# Altium project EVLSERVO1_control_v2.PrjPcb (part 9 of 9)
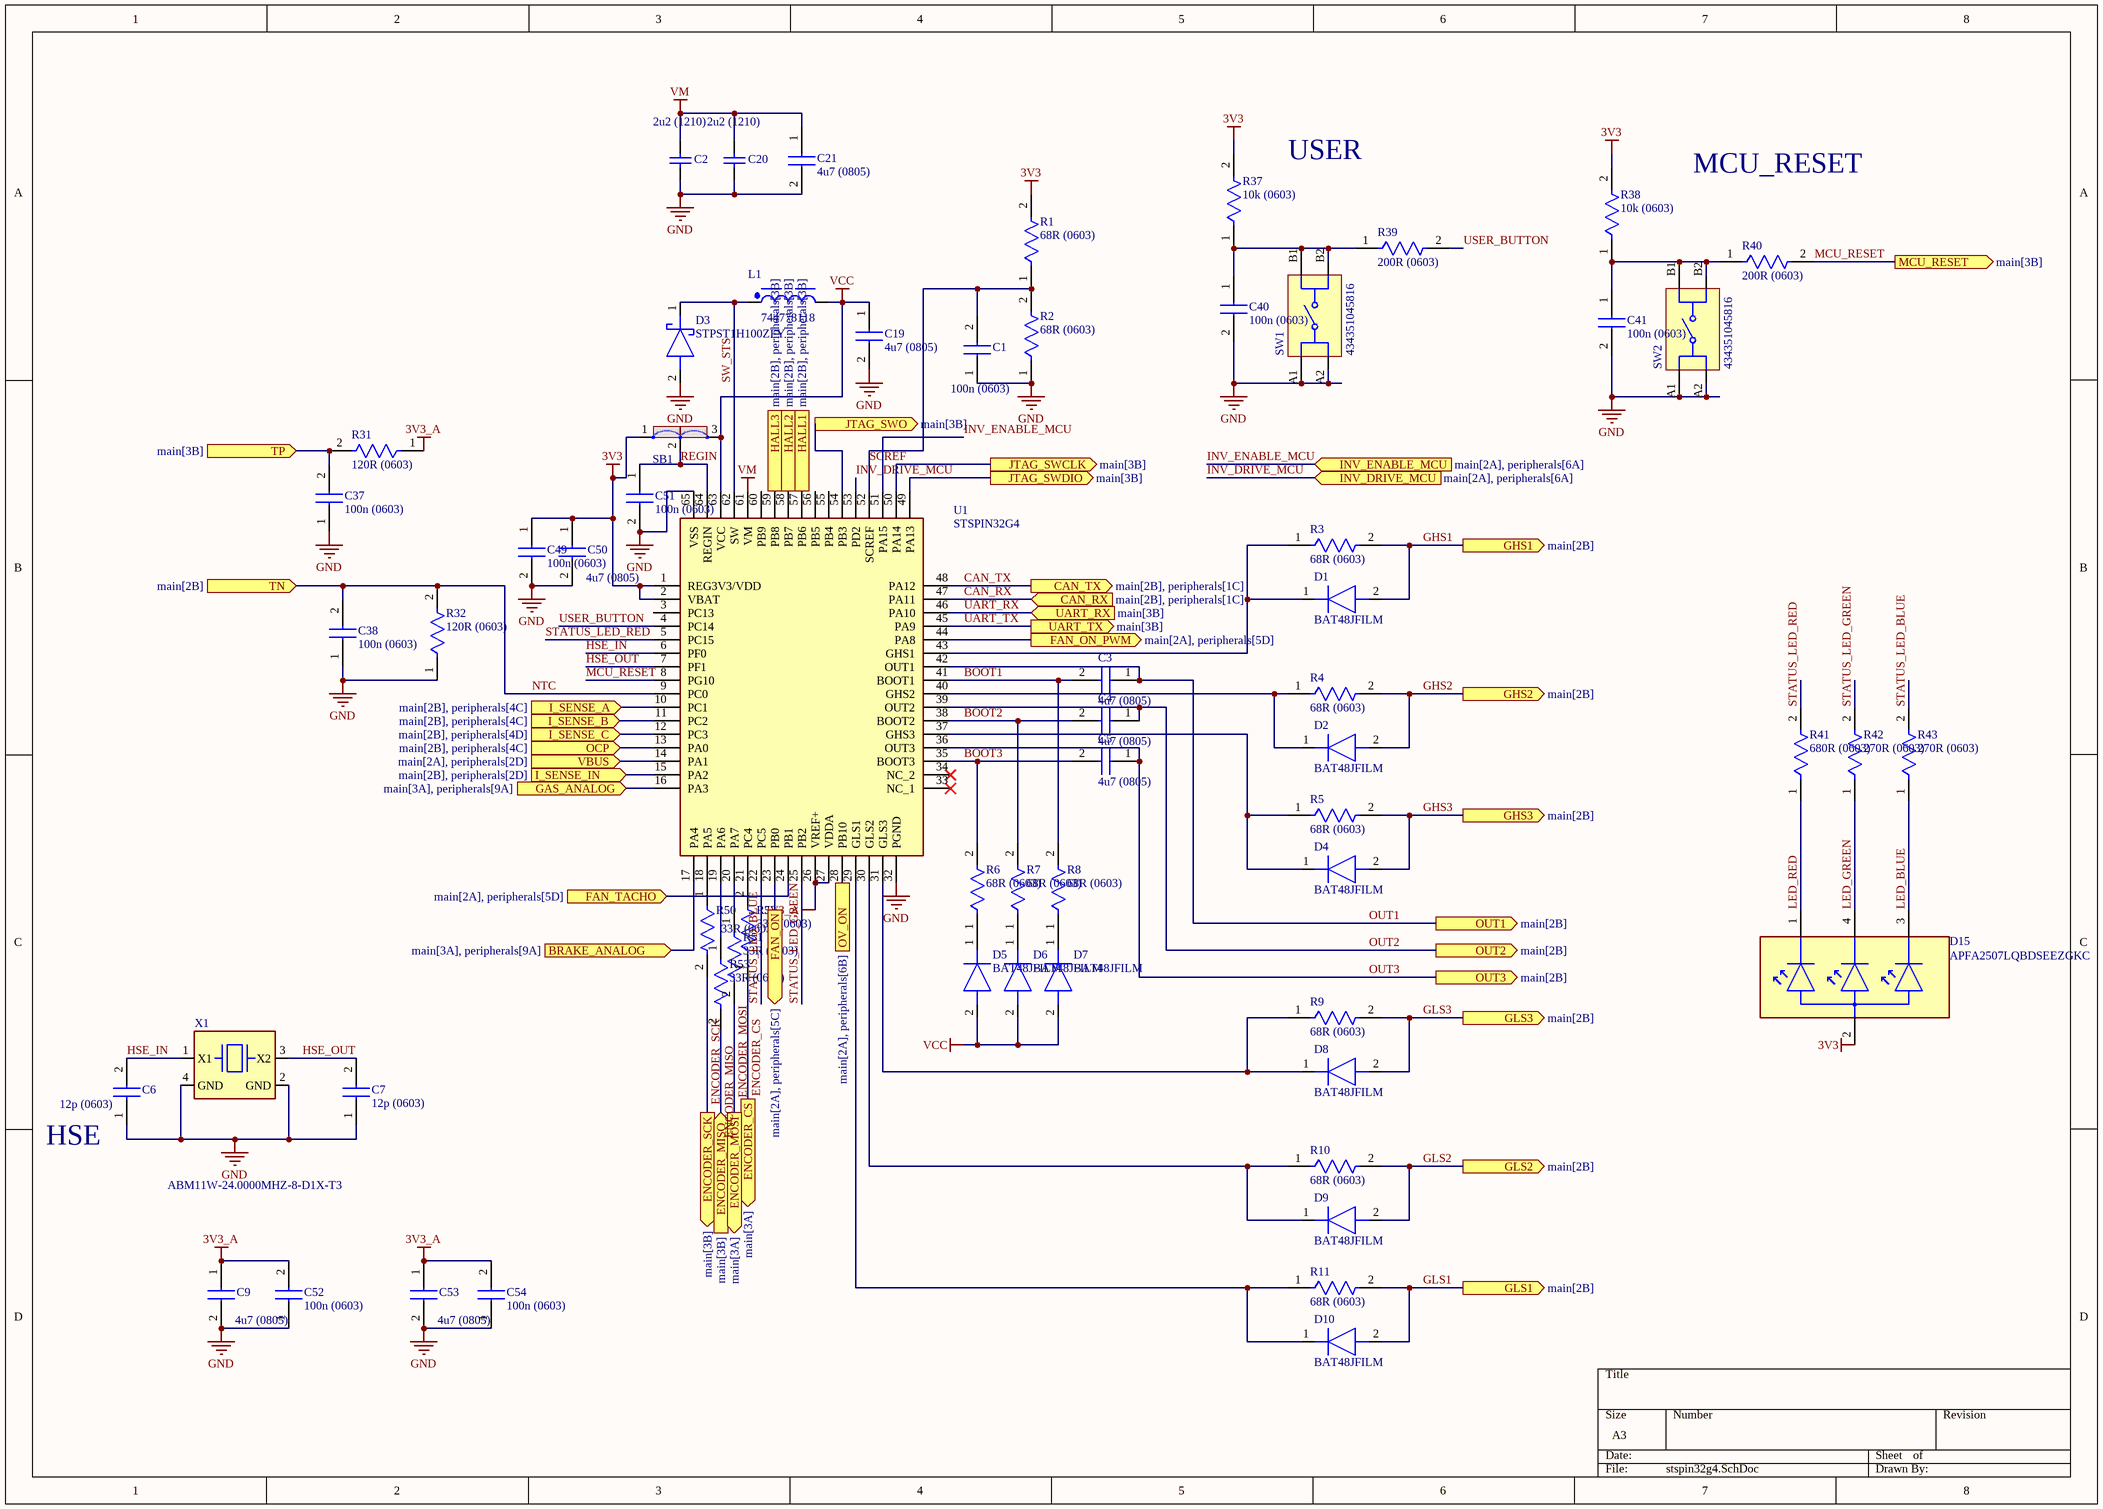
[diagram p12: stspin32g4.SchDoc]

## Sheet stspin32g4.SchDoc (continued)

### Library data of the parts (continued)
R50-R53 = RK73H1JTTD33R0F: Res Thick Film 0603 33 Ohm 1% 0.125W(1/8W) ±100ppm/C Pad SMD Automotive T/R; Manufacturer_Name: Yageo Group; Manufacturer_Part_Number: SR0603FR-7T10KL; Power Rating: 250mW; Value: 10kΩ; Temperature Coefficient: 100ppm/°C; Voltage Rating: 75V; Working Voltage: 150V; Voltage Rating (DC): 50V; Datasheet Link: https://mouser.componentsearchengine.com/Datasheets/1/SR0603FR-7T10KL.pdf; Height: 0.55mm; Mouser Part Number: 603-SR0603FR-7T10KL; Mouser Price/Stock: https://www.mouser.co.uk/ProductDetail/YAGEO/SR0603FR-7T10KL?qs=pfd5qewlna6IurLw3u3uRA%3D%3D; Arrow Part Number: SR0603FR-7T10KL; Arrow Price/Stock: https://www.arrow.com/en/products/sr0603fr-7t10kl/yageo; Supplier: DigiKey; Supplier Part Number: YAG5823CT-ND; Manufacturer: Yageo Group; Manufacturer Part Number: SR0603FR-7T10KL; RoHS: Compliant; Category: Chip SMD Resistors; Pricing: 1=0,67, 10=0,399, 25=0,3376, 50=0,3022, 100=0,2744, 250=0,24612, 500=0,22976, 1000=0,21675 (USD); Case/Package: 0603; China RoHS: Non-Compliant; Composition: Thick Film; Country of Origin: Mainland China, Taiwan; Export Control Classification Number (ECCN) Code: EAR99; Harmonized Tariff Schedule (HTS) Code: 8533.21.00.30; Introduction Date: 2017-10-02; Length: 1.6mm; Lifecycle Status: Production; Max Operating Temperature: 155°C; Min Operating Temperature: -55°C; Mounting Technology: Surface Mount; Number of Terminals: 2; Packaging: Tape & Reel; Ratings: AEC-Q200; REACH SVHC: Yes; Tolerance: 1%; Width: 800µm; ComponentLink1URL: https://datasheet.octopart.com:443/SR0603FR-7T10KL-Yageo-datasheet-176402240.pdf?src-supplier=Farnell; ComponentLink1Description: https://datasheet.octopart.com:443/SR0603FR-7T10KL-Yageo-datasheet-176402240.pdf?src-supplier=Farnell; ComponentLink2URL: https://datasheet.octopart.com:443/SR0603FR-7T10KL-Yageo-datasheet-119732217.pdf?src-supplier=Upverter; ComponentLink2Description: https://datasheet.octopart.com:443/SR0603FR-7T10KL-Yageo-datasheet-119732217.pdf?src-supplier=Upverter; ComponentLink3URL: https://datasheet.octopart.com:443/SR0603FR-7T10KL-Yageo-Group-datasheet-184785656.pdf?src-supplier=Future+Electronics; ComponentLink3Description: https://datasheet.octopart.com:443/SR0603FR-7T10KL-Yageo-Group-datasheet-184785656.pdf?src-supplier=Future+Electronics; ComponentLink4URL: https://datasheet.octopart.com:443/SR0603FR-7T10KL-Yageo-datasheet-155675517.pdf?src-supplier=Future+Electronics; ComponentLink4Description: https://datasheet.octopart.com:443/SR0603FR-7T10KL-Yageo-datasheet-155675517.pdf?src-supplier=Future+Electronics; ComponentLink5URL: https://datasheet.octopart.com:443/SR0603FR-7T10KL-Yageo-datasheet-137701088.pdf?src-supplier=Future+Electronics; ComponentLink5Description: https://datasheet.octopart.com:443/SR0603FR-7T10KL-Yageo-datasheet-137701088.pdf?src-supplier=Future+Electronics; ComponentLink6URL: https://datasheet.octopart.com/SR0603FR-7T10KL-Yageo-datasheet-11047080.pdf; ComponentLink6Description: https://datasheet.octopart.com/SR0603FR-7T10KL-Yageo-datasheet-11047080.pdf; ComponentLink7URL: http://sigma.octopart.com:80/conflict_mineral_statement/Yageo-company-3.pdf?src-supplier=Compliance+Statements; ComponentLink7Description: http://sigma.octopart.com:80/conflict_mineral_statement/Yageo-company-3.pdf?src-supplier=Compliance+Statements; ComponentLink8URL: http://sigma.octopart.com:80/rohs_statement/Yageo-company-2.pdf?src-supplier=Compliance+Statements; ComponentLink8Description: http://sigma.octopart.com:80/rohs_statement/Yageo-company-2.pdf?src-supplier=Compliance+Statements; Stock: 5000; ComponentLink9URL: https://datasheet.octopart.com:443/SR0603FR-7T4R7L-Yageo-datasheet-176402240.pdf?src-supplier=Farnell; ComponentLink9Description: https://datasheet.octopart.com:443/SR0603FR-7T4R7L-Yageo-datasheet-176402240.pdf?src-supplier=Farnell; ComponentLink10URL: https://datasheet.octopart.com:443/SR0603FR-7T4R7L-Yageo-datasheet-119732217.pdf?src-supplier=Upverter; ComponentLink10Description: https://datasheet.octopart.com:443/SR0603FR-7T4R7L-Yageo-datasheet-119732217.pdf?src-supplier=Upverter; ComponentLink11URL: https://datasheet.octopart.com:443/SR0603FR-7T4R7L-Yageo-Group-datasheet-184785656.pdf?src-supplier=Future+Electronics; ComponentLink11Description: https://datasheet.octopart.com:443/SR0603FR-7T4R7L-Yageo-Group-datasheet-184785656.pdf?src-supplier=Future+Electronics; ComponentLink12URL: https://datasheet.octopart.com:443/SR0603FR-7T4R7L-Yageo-datasheet-155675517.pdf?src-supplier=Future+Electronics; ComponentLink12Description: https://datasheet.octopart.com:443/SR0603FR-7T4R7L-Yageo-datasheet-155675517.pdf?src-supplier=Future+Electronics; ComponentLink13URL: https://datasheet.octopart.com:443/SR0603FR-7T4R7L-Yageo-datasheet-137701088.pdf?src-supplier=Future+Electronics; ComponentLink13Description: https://datasheet.octopart.com:443/SR0603FR-7T4R7L-Yageo-datasheet-137701088.pdf?src-supplier=Future+Electronics; ComponentLink14URL: https://datasheet.octopart.com/SR0603FR-7T4R7L-Yageo-datasheet-11047080.pdf; ComponentLink14Description: https://datasheet.octopart.com/SR0603FR-7T4R7L-Yageo-datasheet-11047080.pdf; Schedule B: 8533210045, 8533210045|8533210045|8533210045|8533210045|8533210045; ComponentLink15URL: https://datasheet.octopart.com:443/SR0603FR-7T100KL-Yageo-datasheet-176402240.pdf?src-supplier=element14+APAC; ComponentLink15Description: https://datasheet.octopart.com:443/SR0603FR-7T100KL-Yageo-datasheet-176402240.pdf?src-supplier=element14+APAC; ComponentLink16URL: https://datasheet.octopart.com:443/SR0603FR-7T100KL-Yageo-datasheet-119732217.pdf?src-supplier=Upverter; ComponentLink16Description: https://datasheet.octopart.com:443/SR0603FR-7T100KL-Yageo-datasheet-119732217.pdf?src-supplier=Upverter; ComponentLink17URL: https://datasheet.octopart.com:443/SR0603FR-7T100KL-Yageo-Group-datasheet-184785656.pdf?src-supplier=Future+Electronics; ComponentLink17Description: https://datasheet.octopart.com:443/SR0603FR-7T100KL-Yageo-Group-datasheet-184785656.pdf?src-supplier=Future+Electronics; ComponentLink18URL: https://datasheet.octopart.com:443/SR0603FR-7T100KL-Yageo-datasheet-155675517.pdf?src-supplier=Future+Electronics; ComponentLink18Description: https://datasheet.octopart.com:443/SR0603FR-7T100KL-Yageo-datasheet-155675517.pdf?src-supplier=Future+Electronics; ComponentLink19URL: https://datasheet.octopart.com:443/SR0603FR-7T100KL-Yageo-datasheet-137701088.pdf?src-supplier=Future+Electronics; ComponentLink19Description: https://datasheet.octopart.com:443/SR0603FR-7T100KL-Yageo-datasheet-137701088.pdf?src-supplier=Future+Electronics; ComponentLink20URL: https://datasheet.octopart.com/SR0603FR-7T100KL-Yageo-datasheet-11047080.pdf; ComponentLink20Description: https://datasheet.octopart.com/SR0603FR-7T100KL-Yageo-datasheet-11047080.pdf; Case Code (Imperial): 0603; Case Code (Metric): 1608; Depth: 800µm; Lead Free: Lead Free; Military Standard: Not; Pins: 2; Termination: SMD/SMT; ComponentLink21URL: https://datasheet.octopart.com:443/RK73H1JTTD1001F-KOA-Speer-datasheet-181956035.pdf?src-supplier=IHS; ComponentLink21Description: https://datasheet.octopart.com:443/RK73H1JTTD1001F-KOA-Speer-datasheet-181956035.pdf?src-supplier=IHS; ComponentLink22URL: https://datasheet.octopart.com/RK73H1JTTD1001F-KOA-Speer-datasheet-11590619.pdf; ComponentLink22Description: https://datasheet.octopart.com/RK73H1JTTD1001F-KOA-Speer-datasheet-11590619.pdf; ComponentLink23URL: https://datasheet.octopart.com:443/RK73H1JTTD1001F-KOA-Speer-datasheet-149653815.pdf?src-supplier=element14+APAC; ComponentLink23Description: https://datasheet.octopart.com:443/RK73H1JTTD1001F-KOA-Speer-datasheet-149653815.pdf?src-supplier=element14+APAC; ComponentLink24URL: https://datasheet.octopart.com:443/RK73H1JTTD1001F-KOA-Speer-datasheet-10854116.pdf?src-supplier=element14+APAC; ComponentLink24Description: https://datasheet.octopart.com:443/RK73H1JTTD1001F-KOA-Speer-datasheet-10854116.pdf?src-supplier=element14+APAC; ComponentLink25URL: https://datasheet.octopart.com:443/RK73H1JTTD1001F-KOA-Speer-datasheet-188906116.pdf?src-supplier=TME; ComponentLink25Description: https://datasheet.octopart.com:443/RK73H1JTTD1001F-KOA-Speer-datasheet-188906116.pdf?src-supplier=TME; ComponentLink26URL: https://datasheet.octopart.com:443/RK73H1JTTD1001F-KOA-Speer-datasheet-155997623.pdf?src-supplier=Future+Electronics; ComponentLink26Description: https://datasheet.octopart.com:443/RK73H1JTTD1001F-KOA-Speer-datasheet-155997623.pdf?src-supplier=Future+Electronics; ComponentLink27URL: https://datasheet.octopart.com:443/RK73H1JTTD1001F-KOA-Speer-datasheet-11541643.pdf?src-supplier=Arrow+Electronics; ComponentLink27Description: https://datasheet.octopart.com:443/RK73H1JTTD1001F-KOA-Speer-datasheet-11541643.pdf?src-supplier=Arrow+Electronics; ComponentLink28URL: https://datasheet.octopart.com:443/RK73H1JTTD1001F-KOA-Speer-datasheet-5377369.pdf?src-supplier=Garrett; ComponentLink28Description: https://datasheet.octopart.com:443/RK73H1JTTD1001F-KOA-Speer-datasheet-5377369.pdf?src-supplier=Garrett; ComponentLink29URL: https://datasheet.octopart.com:443/RK73H1JTTD1001F-KOA-Speer-datasheet-5377256.pdf?src-supplier=Garrett; ComponentLink29Description: https://datasheet.octopart.com:443/RK73H1JTTD1001F-KOA-Speer-datasheet-5377256.pdf?src-supplier=Garrett; ComponentLink30URL: https://datasheet.octopart.com:443/RK73H1JTTD1001F-KOA-Speer-datasheet-109233.pdf?src-supplier=Garrett; ComponentLink30Description: https://datasheet.octopart.com:443/RK73H1JTTD1001F-KOA-Speer-datasheet-109233.pdf?src-supplier=Garrett; ComponentLink31URL: https://datasheet.octopart.com:443/RK73H1JTTD1001F-KOA-Speer-datasheet-5313488.pdf?src-supplier=Verical; ComponentLink31Description: https://datasheet.octopart.com:443/RK73H1JTTD1001F-KOA-Speer-datasheet-5313488.pdf?src-supplier=Verical; ComponentLink32URL: http://sigma.octopart.com:80/rohs_statement/KOA-Speer-company-17.pdf?src-supplier=Compliance+Statements; ComponentLink32Description: http://sigma.octopart.com:80/rohs_statement/KOA-Speer-company-17.pdf?src-supplier=Compliance+Statements; ComponentLink33URL: https://datasheet.octopart.com:443/RK73H1JTTD33R0F-KOA-Speer-datasheet-181956035.pdf?src-supplier=IHS; ComponentLink33Description: https://datasheet.octopart.com:443/RK73H1JTTD33R0F-KOA-Speer-datasheet-181956035.pdf?src-supplier=IHS; ComponentLink34URL: https://datasheet.octopart.com:443/RK73H1JTTD33R0F-KOA-Speer-datasheet-11590619.pdf?src-supplier=Upverter; ComponentLink34Description: https://datasheet.octopart.com:443/RK73H1JTTD33R0F-KOA-Speer-datasheet-11590619.pdf?src-supplier=Upverter; ComponentLink35URL: https://datasheet.octopart.com:443/RK73H1JTTD33R0F-KOA-Speer-datasheet-149653815.pdf?src-supplier=element14+APAC; ComponentLink35Description: https://datasheet.octopart.com:443/RK73H1JTTD33R0F-KOA-Speer-datasheet-149653815.pdf?src-supplier=element14+APAC; ComponentLink36URL: https://datasheet.octopart.com:443/RK73H1JTTD33R0F-KOA-Speer-datasheet-10854116.pdf?src-supplier=element14+APAC; ComponentLink36Description: https://datasheet.octopart.com:443/RK73H1JTTD33R0F-KOA-Speer-datasheet-10854116.pdf?src-supplier=element14+APAC; ComponentLink37URL: https://datasheet.octopart.com:443/RK73H1JTTD33R0F-KOA-Speer-datasheet-188906116.pdf?src-supplier=TME; ComponentLink37Description: https://datasheet.octopart.com:443/RK73H1JTTD33R0F-KOA-Speer-datasheet-188906116.pdf?src-supplier=TME; ComponentLink38URL: https://datasheet.octopart.com:443/RK73H1JTTD33R0F-KOA-Speer-datasheet-164280812.pdf?src-supplier=Future+Electronics; ComponentLink38Description: https://datasheet.octopart.com:443/RK73H1JTTD33R0F-KOA-Speer-datasheet-164280812.pdf?src-supplier=Future+Electronics
SW1 SW2 = CMP-1461-00002-5: Switch Tactile N.O. SPST Rectangular Button Gull Wing 0.05A 12VDC 200000Cycles 1.57N SMD T/R; Contact Resistance: 100mΩ; Life (Cycles): 200kcycles; Operating Force: 1.6N; Contact Current Rating: 50mA; Voltage Rating (DC): 12V; Insulation Resistance: 100MΩ; Max Operating Temperature: 85°C; Mount: Surface Mount; RoHS: Compliant; Width: 4.7mm; Height: 1.65mm; Packaging: Tape and Reel; Contact Plating: Silver; Min Operating Temperature: -40°C; Current Rating: 50mA; Voltage Rating: 12V
U1 = STSPIN32G4: Integrated Circuit; Manufacturer_Name: STMicroelectronics; Datasheet Link: https://www.st.com/resource/en/datasheet/stspin32g4.pdf; Height: 1mm; Manufacturer_Part_Number: STSPIN32G4; Mouser Part Number: 511-STSPIN32G4; Mouser Price/Stock: https://www.mouser.co.uk/ProductDetail/STMicroelectronics/STSPIN32G4?qs=DRkmTr78QAT8JT82Qbof2g%3D%3D; Arrow Part Number: STSPIN32G4; Arrow Price/Stock: https://www.arrow.com/en/products/stspin32g4/stmicroelectronics.html?utm_currency=USD&region=nac
X1 = ABM11W-24.0000MHZ-8-D1X-T3: Crystal, Quartz, 24 MHz, SMD, 2mm x 1.6mm x 0.5mm, 20 ppm, 8 pF, 10 ppm, ABM11W; Manufacturer: Abracon; MF: Abracon LLC; ESR (Equivalent Series Resistance): 100Ω; Frequency: 24MHz; Frequency Stability: 20ppm; Frequency Tolerance: 0.001%; Load Capacitance: 8pF; ESR: 30Ω; SnapEDA_Link: https://www.snapeda.com/parts/ABM11W-24.0000MHZ-8-D1X-T3/Abracon/view-part/?ref=snap; Package: SMD-4 Abracon LLC; Value: *; MP: ABM11W-24.0000MHZ-8-D1X-T3; Check_prices: https://www.snapeda.com/parts/ABM11W-24.0000MHZ-8-D1X-T3/Abracon/view-part/?ref=eda; Supplier: DigiKey; Supplier Part Number: 535-13835-1-ND; Manufacturer Part Number: ABM11W-24.0000MHZ-8-D1X-T3; RoHS: Compliant; Category: Crystals; Stock: 2752; Pricing: 1=0,38, 10=0,334, 25=0,3156, 50=0,3024, 100=0,29, 250=0,27424, 500=0,26288, 1000=0,25201 (USD); China RoHS: Compliant; Height: 500µm; Length: 2mm; Lifecycle Status: Production; Max Operating Temperature: 85°C; Min Operating Temperature: -40°C; Mounting Technology: Surface Mount; REACH SVHC: Yes; Tolerance: 0.001%; Width: 1.6mm; ComponentLink1URL: https://datasheet.octopart.com:443/ABM11W-24.0000MHZ-8-D1X-T3-Abracon-datasheet-154833168.pdf?src-supplier=IHS; ComponentLink1Description: https://datasheet.octopart.com:443/ABM11W-24.0000MHZ-8-D1X-T3-Abracon-datasheet-154833168.pdf?src-supplier=IHS; ComponentLink2URL: https://datasheet.octopart.com:443/ABM11W-24.0000MHZ-8-D1X-T3-Abracon-datasheet-102760955.pdf?src-supplier=Upverter; ComponentLink2Description: https://datasheet.octopart.com:443/ABM11W-24.0000MHZ-8-D1X-T3-Abracon-datasheet-102760955.pdf?src-supplier=Upverter; ComponentLink3URL: https://datasheet.octopart.com:443/ABM11W-24.0000MHZ-8-D1X-T3-Abracon-datasheet-112015802.pdf?src-supplier=Master+Electronics; ComponentLink3Description: https://datasheet.octopart.com:443/ABM11W-24.0000MHZ-8-D1X-T3-Abracon-datasheet-112015802.pdf?src-supplier=Master+Electronics; ComponentLink4URL: https://datasheet.octopart.com:443/ABM11W-24.0000MHZ-8-D1X-T3-Abracon-datasheet-182204996.pdf?src-supplier=Master+Electronics; ComponentLink4Description: https://datasheet.octopart.com:443/ABM11W-24.0000MHZ-8-D1X-T3-Abracon-datasheet-182204996.pdf?src-supplier=Master+Electronics; ComponentLink5URL: https://sigma.octopart.com:443/141159858/technical_drawing/Abracon-ABM11W-24.0000MHZ-8-D1X-T3.pdf?src-supplier=Abracon+SCT; ComponentLink5Description: https://sigma.octopart.com:443/141159858/technical_drawing/Abracon-ABM11W-24.0000MHZ-8-D1X-T3.pdf?src-supplier=Abracon+SCT; ComponentLink6URL: http://sigma.octopart.com:80/conflict_mineral_statement/Abracon-company-27.pdf?src-supplier=Compliance+Statements; ComponentLink6Description: http://sigma.octopart.com:80/conflict_mineral_statement/Abracon-company-27.pdf?src-supplier=Compliance+Statements

## Nets that join several sheets
3V3: main (5 pins), peripherals (19 pins), power (L3.1 R71.1), stspin32g4 (9 pins)
3V3_A: peripherals (16 pins), power (C22.2 C55.2 L3.2), stspin32g4 (7 pins)
5V: main (C32.1 C35.1 J1.5), peripherals (L4.1), power (7 pins)
5V_EXT: peripherals (C65.2 U6.8), power (5 pins)
5V_FAN: main (J8.4), peripherals (C58.2 Q2.3)
12V_EXT: main (J5.2), power (C66.2 C67.2 R54.2 U16.1)
GND: main (17 pins), peripherals (57 pins), power (16 pins), stspin32g4 (29 pins)
GND_EXT: main (J5.1), peripherals (9 pins), power (9 pins)
VCC: peripherals (C48.2 U2.1), stspin32g4 (7 pins)
VM: main (FB1.2), power (F2.1), stspin32g4 (C2.2 C20.2 C21.1 U1.61)
VM_SENSE: main (D22.2 F1.2), peripherals (R33.2 R58.2)
BRAKE_ANALOG: peripherals (U11.4), stspin32g4 (U1.17)
BRAKE_ANALOG_IN: main (J9.1), peripherals (R83.1 U18.5)
CAN_N: main (J5.5), peripherals (D12.2 R22.1 U6.6)
CAN_P: main (J5.6), peripherals (D12.1 R22.2 U6.7)
CAN_RX: peripherals (D13.1 U6.3), stspin32g4 (U1.47)
CAN_TX: peripherals (D11.1 U6.2), stspin32g4 (U1.48)
ENCODER_CS: main (J6.1), stspin32g4 (R52.1)
ENCODER_MISO: main (J6.3), stspin32g4 (R53.2)
ENCODER_MOSI: main (J6.2), stspin32g4 (R51.2)
ENCODER_SCK: main (J6.4), stspin32g4 (R50.2)
FAN_ON: peripherals (R65.1), stspin32g4 (U1.23)
FAN_PWM: main (J8.1), peripherals (Q4.3)
FAN_PWM_ON: peripherals (R67.1), stspin32g4 (U1.44)
FAN_TACHO: peripherals (C59.2 R69.1 R70.2), stspin32g4 (U1.24)
FAN_TACHO_IN: main (J8.2), peripherals (R70.1)
GAS_ANALOG: peripherals (U11.6), stspin32g4 (U1.16)
GAS_ANALOG_IN: main (J9.2), peripherals (R82.1 U18.3)
GHS1: main (J2.4), stspin32g4 (D1.2 R3.2)
GHS2: main (J2.6), stspin32g4 (D2.2 R4.2)
GHS3: main (J2.8), stspin32g4 (D4.2 R5.2)
GLS1: main (J4.5), stspin32g4 (D10.2 R11.2)
GLS2: main (J4.3), stspin32g4 (D9.2 R10.2)
GLS3: main (J4.1), stspin32g4 (D8.2 R9.2)
GOV: main (J4.7), peripherals (R62.1 R63.1)
HALL1_IN: main (J1.3), peripherals (R44.1 R47.1)
HALL2_IN: main (J1.2), peripherals (R45.1 R48.1)
HALL3_IN: main (J1.1), peripherals (R46.1 R49.1)
I_SENSE_A: peripherals (C24.2 R23.2), stspin32g4 (U1.10)
I_SENSE_B: peripherals (C26.2 R25.2), stspin32g4 (U1.11)
I_SENSE_C: peripherals (C28.2 R26.2), stspin32g4 (U1.12)
IIN+: main (J10.2), peripherals (U5.8)
IIN-: main (J10.1), peripherals (U5.1)
INV_DRIVE_MCU: peripherals (U14.4), stspin32g4 (U1.53)
INV_ENABLE_MCU: peripherals (U14.6), stspin32g4 (U1.51)
JTAG_SWCLK: main (J7.4 U12.3), stspin32g4 (U1.50)
JTAG_SWDIO: main (J7.2 U12.4), stspin32g4 (U1.49)
JTAG_SWO: main (J7.6 U12.1), stspin32g4 (U1.54)
MCU_RESET: main (J7.10), stspin32g4 (R40.2 U1.8)
NetC29_2: peripherals (C29.2 R27.2), stspin32g4 (U1.15)
NetC42_2: peripherals (C42.2 R47.2), stspin32g4 (U1.57)
NetC43_2: peripherals (C43.2 R48.2), stspin32g4 (U1.58)
NetC44_2: peripherals (C44.2 R49.2), stspin32g4 (U1.59)
NetJ5_3: main (J5.3), peripherals (R76.1 U13.5)
NetJ5_4: main (J5.4), peripherals (R77.1 U13.3)
NTC: main (J3.8), stspin32g4 (C38.2 R32.2 U1.9)
OCP: peripherals (C36.2 R28.1 R29.1 R30.1), stspin32g4 (U1.13)
OUT1: main (J2.3), stspin32g4 (C3.1 U1.42)
OUT2: main (J2.5), stspin32g4 (C4.1 U1.39)
OUT3: main (J2.7), stspin32g4 (C5.1 U1.36)
OV_ON: peripherals (D17.2), stspin32g4 (U1.28)
TP: main (J3.7), stspin32g4 (C37.2 R31.2)
UART_RX: main (J11.2), stspin32g4 (U1.46)
UART_TX: main (J11.1), stspin32g4 (U1.45)
VBUS: peripherals (C39.2 D14.3 R35.2), stspin32g4 (U1.14)
VS1N: main (J3.6), peripherals (U3.1)
VS1P: main (J3.5), peripherals (U3.8)
VS2N: main (J3.4), peripherals (U4.1)
VS2P: main (J3.3), peripherals (U4.8)
VS3N: main (J3.2), peripherals (U7.1)
VS3P: main (J3.1), peripherals (U7.8)